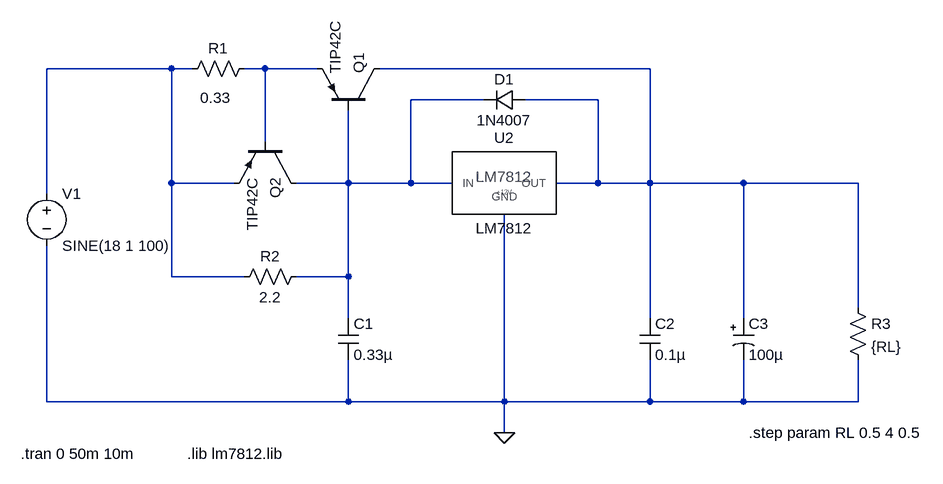
[diagram p0: schematic regulador.asc]
regulador.asc, the LTspice schematic file:
Version 4
SHEET 1 1488 680
WIRE -16 -240 -208 -240
WIRE 16 -240 -16 -240
WIRE 128 -240 96 -240
WIRE 208 -240 128 -240
WIRE 720 -240 304 -240
WIRE 464 -192 352 -192
WIRE 640 -192 528 -192
WIRE 128 -128 128 -240
WIRE -16 -64 -16 -240
WIRE 80 -64 -16 -64
WIRE 256 -64 256 -176
WIRE 256 -64 176 -64
WIRE 352 -64 352 -192
WIRE 352 -64 256 -64
WIRE 416 -64 352 -64
WIRE 640 -64 640 -192
WIRE 640 -64 576 -64
WIRE 720 -64 720 -240
WIRE 720 -64 640 -64
WIRE 864 -64 720 -64
WIRE 1040 -64 864 -64
WIRE -208 -48 -208 -240
WIRE -16 80 -16 -64
WIRE 96 80 -16 80
WIRE 256 80 256 -64
WIRE 256 80 176 80
WIRE 1040 128 1040 -64
WIRE 256 144 256 80
WIRE 720 144 720 -64
WIRE 864 144 864 -64
WIRE -208 272 -208 32
WIRE 256 272 256 208
WIRE 256 272 -208 272
WIRE 496 272 496 -16
WIRE 496 272 256 272
WIRE 720 272 720 208
WIRE 720 272 496 272
WIRE 864 272 864 208
WIRE 864 272 720 272
WIRE 1040 272 1040 208
WIRE 1040 272 864 272
WIRE 496 320 496 272
FLAG 496 320 0
SYMBOL pnp 304 -176 M270
SYMATTR InstName Q1
SYMATTR Value TIP42C
SYMBOL res 112 -256 R90
WINDOW 0 0 56 VBottom 2
WINDOW 3 45 60 VTop 2
SYMATTR InstName R1
SYMATTR Value 0.33
SYMBOL res 192 64 R90
WINDOW 0 0 56 VBottom 2
WINDOW 3 32 56 VTop 2
SYMATTR InstName R2
SYMATTR Value 2.2
SYMBOL cap 240 144 R0
SYMATTR InstName C1
SYMATTR Value 0.33µ
SYMBOL cap 704 144 R0
SYMATTR InstName C2
SYMATTR Value 0.1µ
SYMBOL LM7812 496 -64 R0
SYMATTR InstName U2
SYMBOL polcap 848 144 R0
SYMATTR InstName C3
SYMATTR Value 100µ
SYMBOL voltage -208 -64 R0
WINDOW 123 0 0 Left 0
WINDOW 39 0 0 Left 0
SYMATTR InstName V1
SYMATTR Value SINE(18 1 100)
SYMBOL res 1024 112 R0
SYMATTR InstName R3
SYMATTR Value {RL}
SYMBOL pnp 176 -128 R90
SYMATTR InstName Q2
SYMATTR Value TIP42C
SYMBOL diode 528 -208 R90
WINDOW 0 0 32 VBottom 2
WINDOW 3 32 32 VTop 2
SYMATTR InstName D1
SYMATTR Value 1N4007
TEXT 8 352 Left 2 !.lib lm7812.lib
TEXT -248 352 Left 2 !.tran 0 50m 10m
TEXT 872 320 Left 2 !.step param RL 0.5 4 0.5

The netlist it stands for:
* regulador.asc
Q1 N003 N004 N002 0 TIP42C
R1 N002 N001 0.33
R2 N004 N001 2.2
C1 N004 0 0.33µ
C2 N003 0 0.1µ
XU2 N004 0 N003 LM7812  ; pins IN GND OUT
C3 N003 0 100µ
V1 N001 0 SINE(18 1 100)
R3 N003 0 {RL}
Q2 N004 N002 N001 0 TIP42C
D1 N003 N004 1N4007
.model D D
.lib standard.dio
.model NPN NPN
.model PNP PNP
.lib standard.bjt
.lib lm7812.lib
.tran 0 50m 10m
.step param RL 0.5 4 0.5
.lib lm7812.lib
.backanno
.end